# Altium schematic sheet Aux_branch.SchDoc
size A4; SheetNumber: 4; SheetTotal: 6
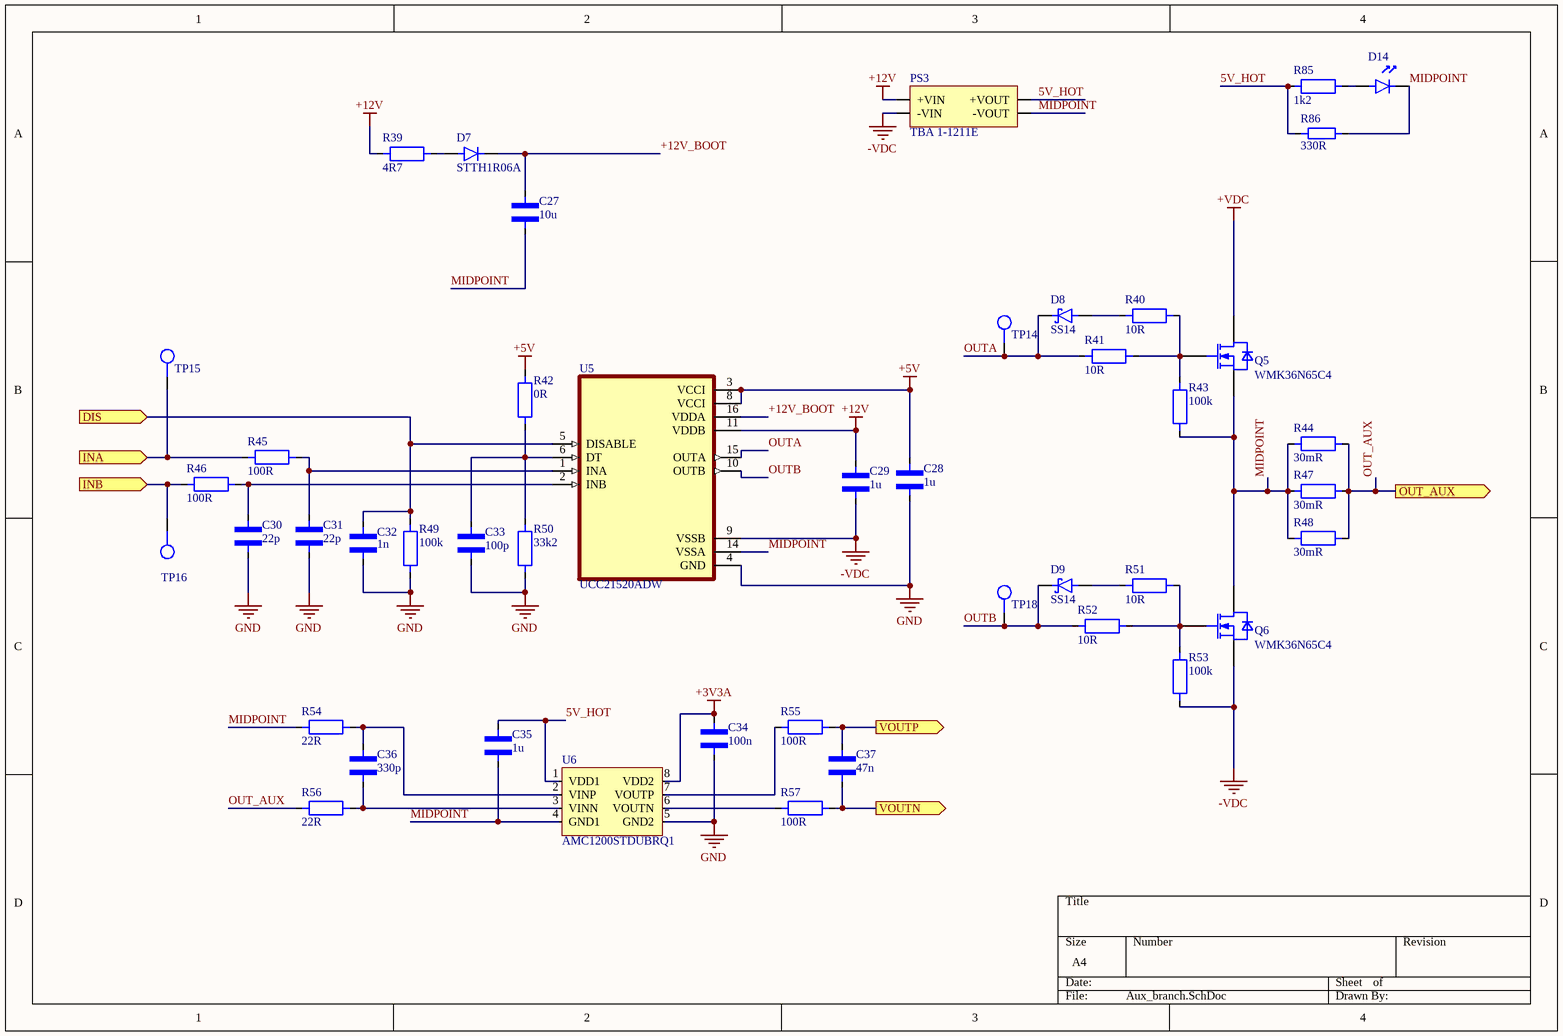
[diagram p0: Aux_branch.SchDoc]

## Parts
C27  10u  [CAPACITOR_1206]
C28  1u  [Capacitor_0805]
C29  1u  [Capacitor_0805]
C30  22p  [Capacitor_0805]
C31  22p  [Capacitor_0805]
C32  1n  [Capacitor_0805]
C33  100p  [Capacitor_0805]
C34  100n  [Capacitor_0805]
C35  1u  [Capacitor_0805]
C36  330p  [Capacitor_0805]
C37  47n  [Capacitor_0805]
D7  STTH1R06A  [STTH1R06A]
D8  SS14  [DIOM5226X230N]
D9  SS14  [DIOM5226X230N]
D14  LTST-C171KRKT  [LTST-C171K]  (value not drawn)
PS3  TBA 1-1211E  [TBA 1-1211E]
Q5  WMK36N65C4  [TO220-3]
Q6  WMK36N65C4  [TO220-3]
R39  4R7  [RESISTOR_1206]
R40  10R  [RESISTOR_0805]
R41  10R  [RESISTOR_0805]
R42  0R  [RESISTOR_0805]
R43  100k  [RESISTOR_0805]
R44  30mR  [MAR251203FR030S]
R45  100R  [RESISTOR_0805]
R46  100R  [RESISTOR_0805]
R47  30mR  [MAR251203FR030S]
R48  30mR  [MAR251203FR030S]
R49  100k  [RESISTOR_0805]
R50  33k2  [RESISTOR_0805]
R51  10R  [RESISTOR_0805]
R52  10R  [RESISTOR_0805]
R53  100k  [RESISTOR_0805]
R54  22R  [RESISTOR_0805]
R55  100R  [RESISTOR_0805]
R56  22R  [RESISTOR_0805]
R57  100R  [RESISTOR_0805]
R85  1k2  [RESISTOR_0805]
R86  330R  [RESISTOR_1206]
TP14  TestPoint  [TestPoint_1.5mm]  (value not drawn)
TP15  TestPoint  [TestPoint_1.5mm]  (value not drawn)
TP16  TestPoint  [TestPoint_1.5mm]  (value not drawn)
TP18  TestPoint  [TestPoint_1.5mm]  (value not drawn)
U5  UCC21520ADW  [UCC21520ADW]
U6  AMC1200STDUBRQ1  [SOP254P1040X485-8N]

## Ports
DIS (in), INA (in), INB (in), OUT_AUX (out), VOUTN (out), VOUTP (out)

## Nets
+3V3A: C34.2 U6.8(VDD2)
+5V: C28.1 R42.2 U5.3(VCCI) U5.8(VCCI)
+12V: C29.2 PS3.1(+VIN) R39.1 U5.11(VDDB)
+VDC: Q5.2(DRAIN)
-VDC: C29.1 PS3.2(-VIN) Q6.3(SOURCE) R53.1 U5.9(VSSB)
GND: C28.2 C30.1 C31.1 C32.1 C33.1 C34.1 R49.1 R50.1 U5.4(GND) U6.5(GND2)
5V_HOT: C35.2 PS3.4(+VOUT) R85.1 R86.1 U6.1(VDD1)
+12V_BOOT: C27.1 D7.2(K) U5.16(VDDA)
DIS: C32.2 R49.2 U5.5(DISABLE) ; port DIS
INA: R45.1 TP15.1 ; port INA
INB: R46.1 TP16.1 ; port INB
MIDPOINT: C27.2 C35.1 D14.2(K) PS3.3(-VOUT) Q5.3(SOURCE) Q6.2(DRAIN) R43.1 R44.1 R47.1 R48.1 R54.1 R86.2 U5.14(VSSA) U6.4(GND1)
OUT_AUX: R44.2 R47.2 R48.2 R56.1 ; port OUT_AUX
OUTA: D8.2(K) R41.1 TP14.1 U5.15(OUTA)
OUTB: D9.2(K) R52.1 TP18.1 U5.10(OUTB)
VOUTN: C37.1 R57.2 ; port VOUTN
VOUTP: C37.2 R55.2 ; port VOUTP
NetC30_2: C30.2 R46.2 U5.2(INB)
NetC31_2: C31.2 R45.2 U5.1(INA)
NetC33_2: C33.2 R42.1 R50.2 U5.6(DT)
NetC36_1: C36.1 R56.2 U6.3(VINN)
NetC36_2: C36.2 R54.2 U6.2(VINP)
NetD7_1: D7.1(A) R39.2
NetD8_1: D8.1(A) R40.1
NetD9_1: D9.1(A) R51.1
NetD14_1: D14.1(A) R85.2
NetQ5_1: Q5.1(GATE) R40.2 R41.2 R43.2
NetQ6_1: Q6.1(GATE) R51.2 R52.2 R53.2
NetR55_1: R55.1 U6.7(VOUTP)
NetR57_1: R57.1 U6.6(VOUTN)

## Library data of the parts
C27 = CAPACITOR_1206: MLCC capacitor in 1206 package
C28-C37 = CAPACITOR_0805: MLCC capacitor in 0805 package
D7 = STTH1R06A: Diode: rectifying; SMD; 600V; 1A; 25ns; SMA; Ufmax: 1V; Ifsm: 20A
D8 D9 = SS14: 1A, 40V, Schottky Rectifier; MF: Taiwan Semiconductor; SnapEDA_Link: https://www.snapeda.com/parts/SS14/taiwan/view-part/?ref=snap; Package: SMA-2 Taiwan Semiconductor; MP: SS14; Check_prices: https://www.snapeda.com/parts/SS14/taiwan/view-part/?ref=eda
D14 = LTST-C171KRKT: LED; red; SMD; 0805; 18÷54mcd; 2÷2.4VDC; 2x1.25x0.8mm; 130°; 20mA
PS3 = TBA 1-1211E: Converter: DC/DC; 1W; Uin: 10.8÷13.2VDC; Uout: 5VDC; Iout: 200mA; pin to pad: 3>4 4>6
Q5 Q6 = WMK36N65C4: Transistor: N-MOSFET; WMOS™ C4; unipolar; 650V; 20A; Idm: 100A; 277W; Manufacturer: WAYON; ManufacturerPartNumber: WMK36N65C4; PackageReference: PG-TO220
R39 R86 = RESISTOR_1206: SMD resistor in 1206 package
R40-R43 R45 R46 R51-R57 R85 = RESISTOR_0805: SMD resistor in 0805 package
  R45: Value: 100R
R44 R47 R48 = MAR251203FR030S: Resistor: thick film; 30mΩ; sensing; SMD; 2512; 3W; ±1%; -55÷170°C; Manufacturer: Wayon; Value: 30mR; ComponentLink1Description: TME; ComponentLink1URL: https://www.tme.eu/pl/details/mar251203fr010s/rezystory-smd/wayon/; Power: 3W; Tolerance: 1%
R49 R50 = RESISTOR_0805: SMD resistor in 0805 package; Value: 100R
U5 = UCC21520ADW: 5.7kVrms, 4A/6A dual-channel isolated gate driver w/ dual input, disable pin, 8V UVLO in DW package; MF: Texas Instruments; SnapEDA_Link: https://www.snapeda.com/parts/UCC21520ADW/Texas+Instruments/view-part/?ref=snap; Package: SOIC-16 Texas Instruments; Value: *; MP: UCC21520ADW; Check_prices: https://www.snapeda.com/parts/UCC21520ADW/Texas+Instruments/view-part/?ref=eda
U6 = AMC1200: AMC1200/B Fully-Differential Isolation Amplifier; Manufacturer: Texas Instruments